# EAGLE design Pcomadapter (EAGLE 9.6.2)
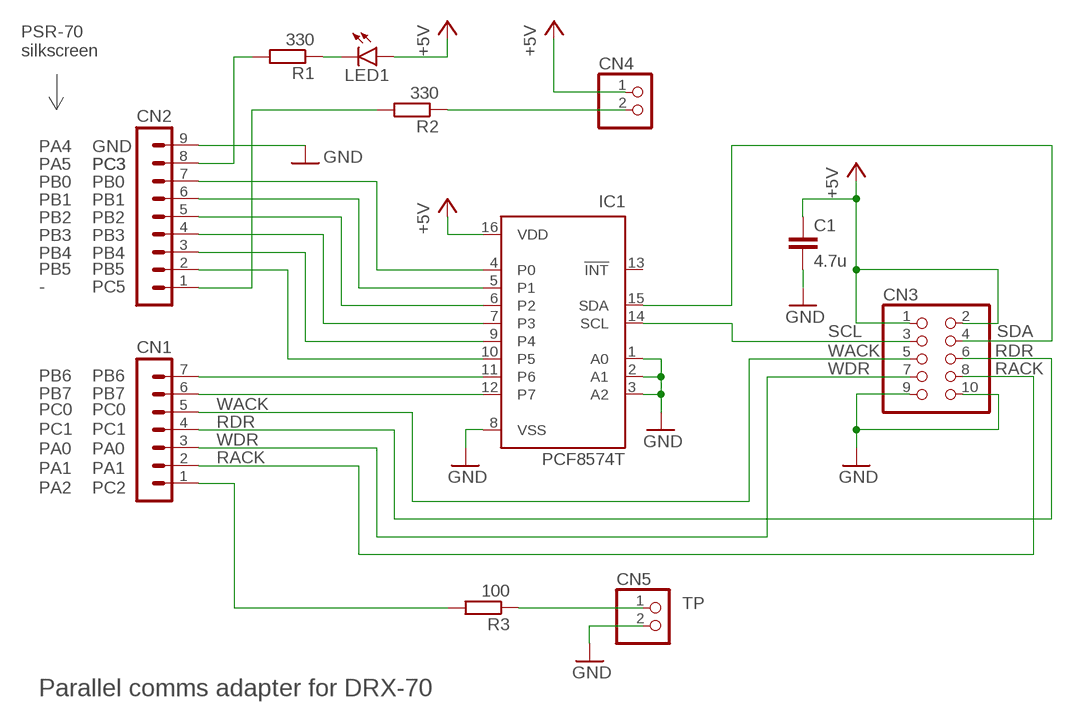
[diagram p0: schematic, sheet 1]

## Parts
C1  4.7u  C-EUC0805  [C0805]
CN1  MA07-1  [MA07-1]
CN2  MA09-1  [MA09-1]
CN3  PINHD-2X5/90  [2X05/90]
CN4  PINHD-1X2/90  [1X02/90]
CN5  PINHD-1X2/90  [1X02/90]
IC1  PCF8574T  [SO16W]
LED1  LED3MM  [LED3MM]
R1  330  R-EU_R0805  [R0805]
R2  330  R-EU_R0805  [R0805]
R3  100  R-EU_R0805  [R0805]

## Nets
+5V: C1.1 CN3.1 CN3.2 CN4.1 IC1.16(VDD) LED1.A
GND: C1.2 CN2.9 CN3.9 CN3.10 CN5.2 IC1.1(A0) IC1.2(A1) IC1.3(A2) IC1.8(VSS)
N$1: CN2.7 IC1.4(P0)
N$2: CN2.6 IC1.5(P1)
N$3: CN2.5 IC1.6(P2)
N$4: CN2.4 IC1.7(P3)
N$5: CN2.3 IC1.9(P4)
N$6: CN2.2 IC1.10(P5)
N$7: CN1.7 IC1.11(P6)
N$8: CN1.6 IC1.12(P7)
N$9: CN1.1 R3.2
N$10: CN5.1 R3.1
N$15: CN2.8 R1.2
N$16: LED1.K(C) R1.1
N$18: CN2.1 R2.2
N$19: CN4.2 R2.1
RACK: CN1.2 CN3.8
RDR: CN1.4 CN3.6
SCL: CN3.3 IC1.14(SCL)
SDA: CN3.4 IC1.15(SDA)
WACK: CN1.5 CN3.5
WDR: CN1.3 CN3.7
Unconnected: IC1.13(!INT)

## Notes on the sheet
- PSR-70
  silkscreen
- PA4 | GND
- PA5 | PC3 | PC3
- PB0 | PB0
- PB1 | PB1
- PB2 | PB2
- PB3 | PB3
- PB4 | PB4
- PB5 | PB5
- - | PC5
- PB6 | PB6
- PB7 | PB7
- PC0 | PC0
- PC1 | PC1
- PA0 | PA0
- PA1 | PA1
- PA2 | PC2
- TP
- Parallel comms adapter for DRX-70

## Library data of the parts
C1 = rcl:C-EU: CAPACITOR, European symbol; SPICEPREFIX: C
CN1 = con-lstb:MA07-1: PIN HEADER; OC_FARNELL: unknown; OC_NEWARK: unknown
CN2 = con-lstb:MA09-1: PIN HEADER; OC_FARNELL: unknown; OC_NEWARK: unknown
CN3 = pinhead:PINHD-2X5: PIN HEADER
CN4 CN5 = pinhead:PINHD-1X2: PIN HEADER
IC1 = micro-philips:PCF8574: I2C-Bus Remote 8-bit I/O expander http://www.semiconductors.philips.com/acrobat_download/datasheets/PCF8574_4.pdf; MPN: PCF8574T/3,512; OC_FARNELL: 1201255; OC_NEWARK: 70R6870
LED1 = led:LED: LED OSRAM: - CHIPLED LG R971, LG N971, LY N971, LG Q971, LY Q971, LO R971, LY R971 LH N974, LH R974 LS Q976, LO Q976, LY Q976 LO Q996 - Hyper CHIPLED LW Q18S LB Q993, LB Q99A, LB R99A - SideLED LS A670, LO A670, LY A670, LG A670, LP A670 LB A673, LV A673, LT A673, LW A673 LH A674 LY A675 LS A676, LA A676, LO A676, LY A676, LW A676 LS A679, LY A679, LG A679 - Hyper Micro SIDELED® LS Y876, LA Y876, LO Y876, LY Y876 LT Y87S - SmartLED LW L88C, LW L88S LB L89C, LB L89S, LG L890 LS L89K, LO L89K, LY L89K LS L896, LA L896, LO L896, LY L896 - TOPLED LS T670, LO T670, LY T670, LG T670, LP T670 LSG T670, LSP T670, LSY T670, LOP T670, LYG T670 LG T671, LOG T671, LSG T671 LB T673, LV T673, LT T673, LW T673 LH T674 LS T676, LA T676, LO T676, LY T676, LB T676, LH T676, LSB T676, LW T676 LB T67C, LV T67C, LT T67C, LS T67K, LO T67K, LY T67K, LW E67C LS E67B, LA E67B, LO E67B, LY E67B, LB E67C, LV E67C, LT E67C LW T67C LS T679, LY T679, LG T679 LS T770, LO T770, LY T770, LG T770, LP T770 LB T773, LV T773, LT T773, LW T773 LH T774 LS E675, LA E675, LY E675, LS T675 LS T776, LA T776, LO T776, LY T776, LB T776 LHGB T686 LT T68C, LB T68C - Hyper Mini TOPLED® LB M676 - Mini TOPLED Santana® LG M470 LS M47K, LO M47K, LY M47K Source: http://www.osram.convergy.de LUXEON: - LUMILED® LXK2-PW12-R00, LXK2-PW12-S00, LXK2-PW14-U00, LXK2-PW14-V00 LXK2-PM12-R00, LXK2-PM12-S00, LXK2-PM14-U00 LXK2-PE12-Q00, LXK2-PE12-R00, LXK2-PE12-S00, LXK2-PE14-T00, LXK2-PE14-U00 LXK2-PB12-K00, LXK2-PB12-L00, LXK2-PB12-M00, LXK2-PB14-N00, LXK2-PB14-P00, LXK2-PB14-Q00 LXK2-PR12-L00, LXK2-PR12-M00, LXK2-PR14-Q00, LXK2-PR14-R00 LXK2-PD12-Q00, LXK2-PD12-R00, LXK2-PD12-S00 LXK2-PH12-R00, LXK2-PH12-S00 LXK2-PL12-P00, LXK2-PL12-Q00, LXK2-PL12-R00 Source: www.luxeon.com KINGBRIGHT: KA-3528ASYC Source: www.kingbright.com
R1-R3 = rcl:R-EU_: RESISTOR, European symbol; SPICEPREFIX: R

## Board
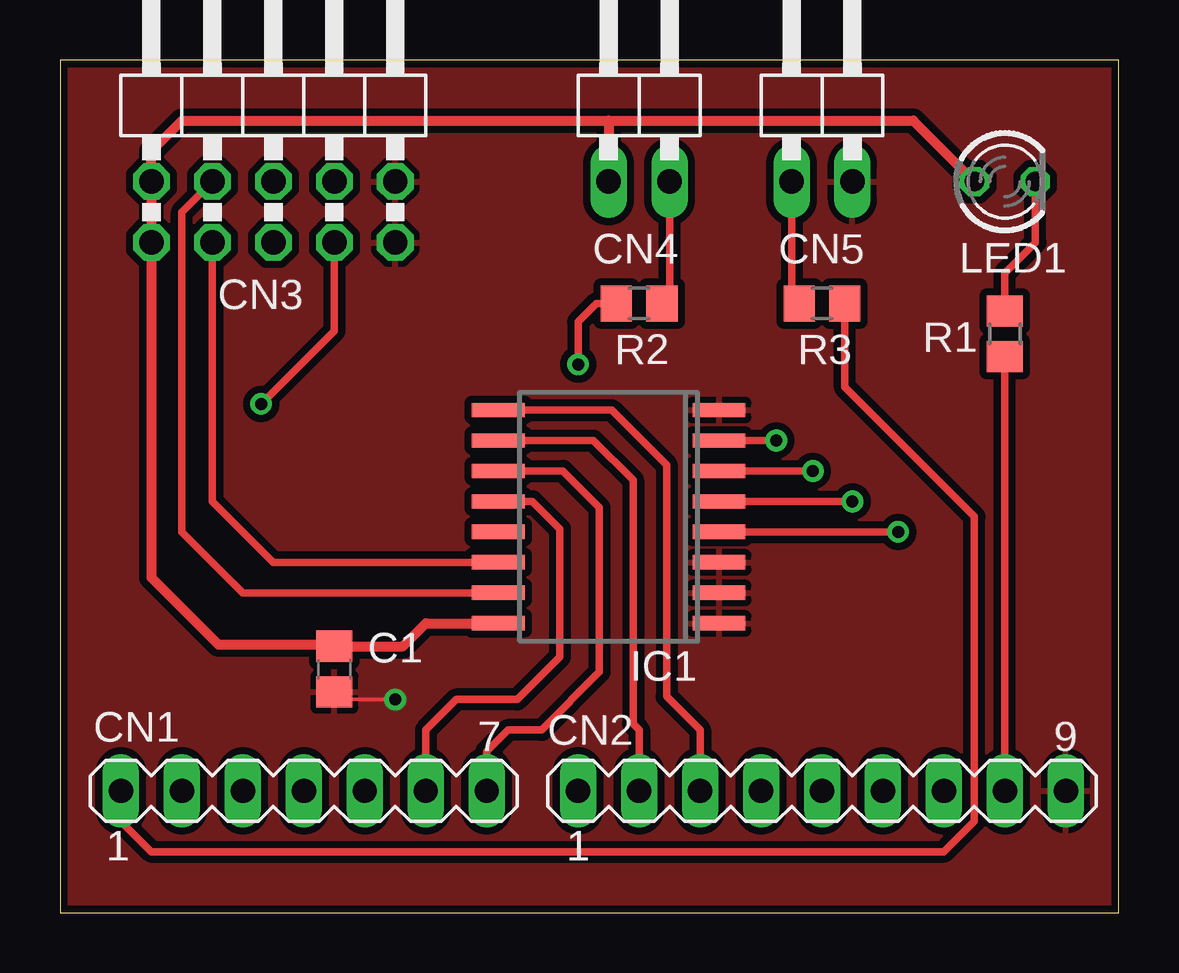
[diagram p1: board, top side]
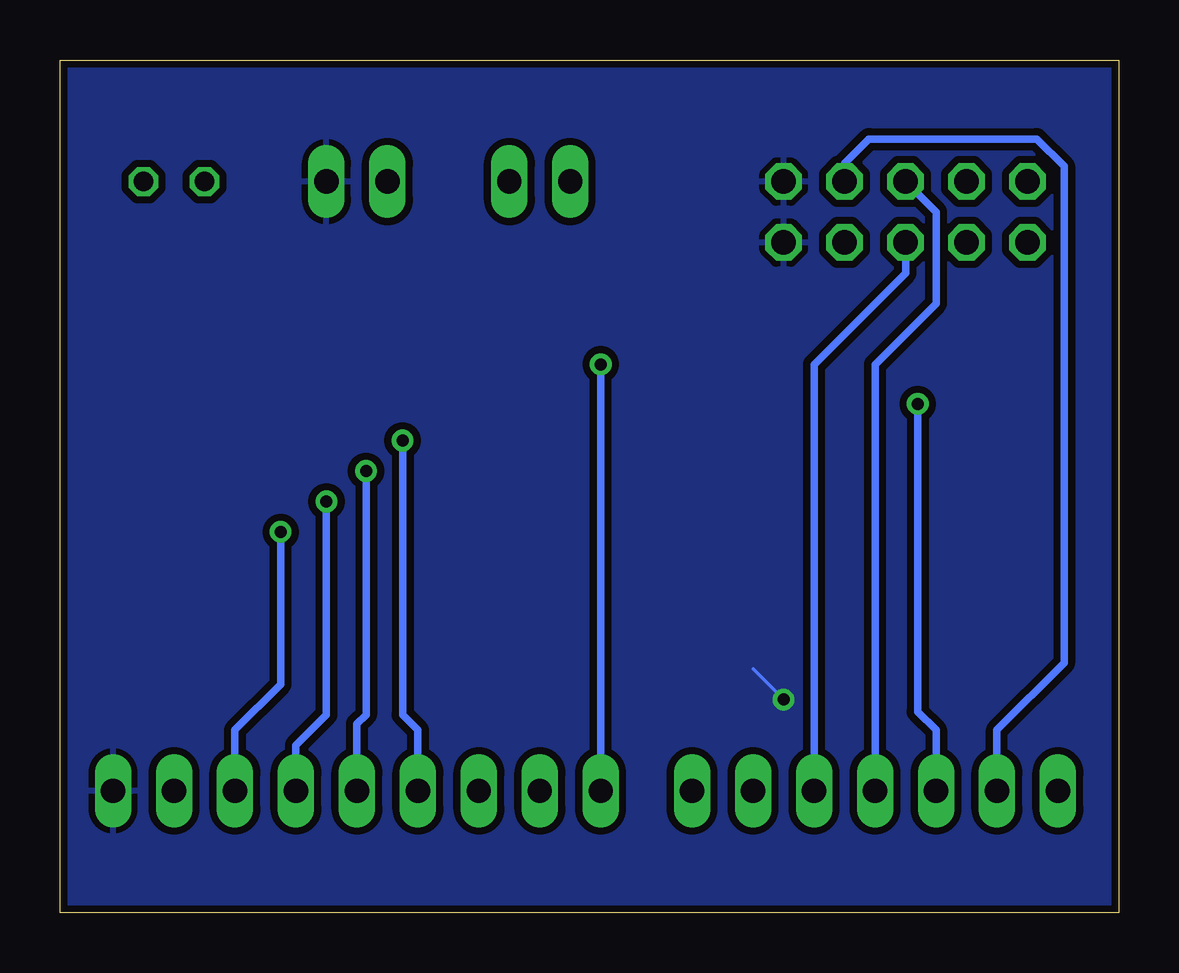
[diagram p2: board, bottom side, seen from below]

Size 44.12 x 35.55 mm. Coordinates in mm from the lower left corner, seen from the top.
Outline: 0,0 44.12,0 44.12,35.55 0,35.55 0,0
Copper layers (1*16): Top 0.035mm / dielectric 1.5mm / Bottom 0.035mm
Design rules "aisler_2_layer_simple_mod": minimum track width 0.1mm, minimum drill 0.3mm, track to track 0.1mm, track to pad 0.1mm, pad to pad 0.1mm, via to via 0.1mm, smd to smd 0.1mm, copper to edge 0.3mm, drill to drill 0.25mm, minimum pad ring 0.2mm, minimum via ring 0.2mm, stop-mask expansion 0mil, vias tented up to drill 20mil, thermal gap 10mil

### Footprints (pad centres in the part's own frame; a part is rotated, then mirrored left to right if it is on the bottom)
C0805 = smd 1.3 x 1.5: 1 -0.95,0; 2 0.95,0
MA07-1 = drill 1.016 long: 1 -7.62,0; 2 -5.08,0; 3 -2.54,0; 4 0,0; 5 2.54,0; 6 5.08,0; 7 7.62,0
MA09-1 = drill 1.016 long: 1 -10.16,0; 2 -7.62,0; 3 -5.08,0; 4 -2.54,0; 5 0,0; 6 2.54,0; 7 5.08,0; 8 7.62,0; 9 10.16,0
2X05/90 = drill 1.016 octagon: 1 -5.08,-6.35; 2 -5.08,-3.81; 3 -2.54,-6.35; 4 -2.54,-3.81; 5 0,-6.35; 6 0,-3.81; 7 2.54,-6.35; 8 2.54,-3.81; 9 5.08,-6.35; 10 5.08,-3.81
1X02/90 = drill 1.016 long: 1 -1.27,-3.81; 2 1.27,-3.81
SO16W = smd 0.6 x 2.2: 1 -4.445,-4.6; 2 -3.175,-4.6; 3 -1.905,-4.6; 4 -0.635,-4.6; 5 0.635,-4.6; 6 1.905,-4.6; 7 3.175,-4.6; 8 4.445,-4.6; 9 4.445,4.6; 10 3.175,4.6; 11 1.905,4.6; 12 0.635,4.6; 13 -0.635,4.6; 14 -1.905,4.6; 15 -3.175,4.6; 16 -4.445,4.6
LED3MM = drill 0.813 octagon: A -1.27,0; K 1.27,0
R0805 = smd 1.3 x 1.5: 1 -0.95,0; 2 0.95,0

### Placement (x,y rotation side)
C1  11.43,10.16 270 top
CN1  10.16,5.08 0 top
CN2  31.75,5.08 0 top
CN3  8.89,34.29 0 top
CN4  24.13,34.29 0 top
CN5  31.75,34.29 0 top
IC1  22.86,16.51 90 top
LED1  39.37,30.48 0 top
R1  39.37,24.13 270 top
R2  24.13,25.4 180 top
R3  31.75,25.4 0 top

### Tracks (layer width: path | path; a pad name or v marks a point on that pad's centre or on a via)
+5V
  Top 0.406: 22.86,33.02 5.08,33.02 3.81,31.75 CN3.2 CN3.1 3.81,13.97 6.6,11.18 11.36,11.18 C1.1 14.29,11.11 15.24,12.06 IC1.16 | 22.86,33.02 CN4.1 | 22.86,33.02 35.56,33.02 LED1.A
GND  (via drill 0.5)
  Top 0.152: C1.2 11.75,8.89 v13.97,8.89
  Bottom 0.152: v13.97,8.89 15.24,10.16
  pour Bottom (isolate 0.305): -1.27,36.83 -1.27,-1.27 45.72,-1.27 45.72,36.83
  pour Top (isolate 0.305): -1.27,36.83 -1.27,-1.27 45.72,-1.27 45.72,36.83
N$1  (via drill 0.5)
  Top 0.305: IC1.4 v34.92,15.88
  Bottom 0.305: CN2.7 36.83,7.62 34.92,9.53 v34.92,15.88
N$2  (via drill 0.5)
  Top 0.305: IC1.5 v33.02,17.14
  Bottom 0.305: v33.02,17.14 33.02,8.26 34.29,6.99 CN2.6
N$3  (via drill 0.5)
  Top 0.305: IC1.6 v31.37,18.41
  Bottom 0.305: v31.37,18.41 31.37,8.26 31.75,7.87 CN2.5
N$4  (via drill 0.5)
  Top 0.305: IC1.7 v29.84,19.68
  Bottom 0.305: v29.84,19.68 29.84,8.26 29.21,7.62 CN2.4
N$5
  Top 0.305: IC1.9 22.99,20.95 25.27,18.67 25.27,9.02 26.67,7.62 CN2.3
N$6
  Top 0.305: IC1.10 22.23,19.68 23.88,18.03 23.88,7.87 24.13,7.62 CN2.2
N$7
  Top 0.305: IC1.11 20.95,18.41 22.48,16.89 22.48,10.03 20.07,7.62 18.67,7.62 17.78,6.73 CN1.7
N$8
  Top 0.305: IC1.12 19.68,17.14 20.83,16 20.83,10.67 19.05,8.89 16.51,8.89 15.24,7.62 CN1.6
N$9
  Top 0.305: CN1.1 2.54,3.81 3.81,2.54 36.83,2.54 38.1,3.81 38.1,16.51 32.7,21.91 R3.2
N$10
  Top 0.305: CN5.1 30.48,25.72 R3.1
N$15
  Top 0.305: CN2.8 R1.2
N$16
  Top 0.305: R1.1 39.37,26.67 40.64,27.94 LED1.K
N$18  (via drill 0.5)
  Top 0.305: R2.2 22.35,25.4 21.59,24.64 v21.59,22.86
  Bottom 0.305: CN2.1 v21.59,22.86
N$19
  Top 0.305: R2.1 25.4,25.4 CN4.2
RACK
  Bottom 0.305: CN1.2 5.08,7.62 2.29,10.41 2.29,31.11 3.43,32.26 10.41,32.26 11.43,31.24 CN3.8
RDR
  Bottom 0.305: CN1.4 10.16,22.86 7.62,25.4 7.62,29.21 CN3.6
SCL
  Top 0.305: IC1.14 8.89,14.61 6.35,17.14 CN3.3
SDA
  Top 0.305: IC1.15 7.62,13.34 5.08,15.88 5.08,29.21 CN3.4
WACK
  Bottom 0.305: CN1.5 12.7,22.86 8.89,26.67 CN3.5
WDR  (via drill 0.5)
  Top 0.305: CN3.7 11.43,24.26 v8.38,21.21
  Bottom 0.305: v8.38,21.21 8.38,8.38 7.62,7.62 CN1.3

### Text on the board
bDocu: DRX-70 PCOM